# EAGLE design mbc_88_24_01_06_ac (EAGLE 7.6.0)

## Sheet 1 of 2
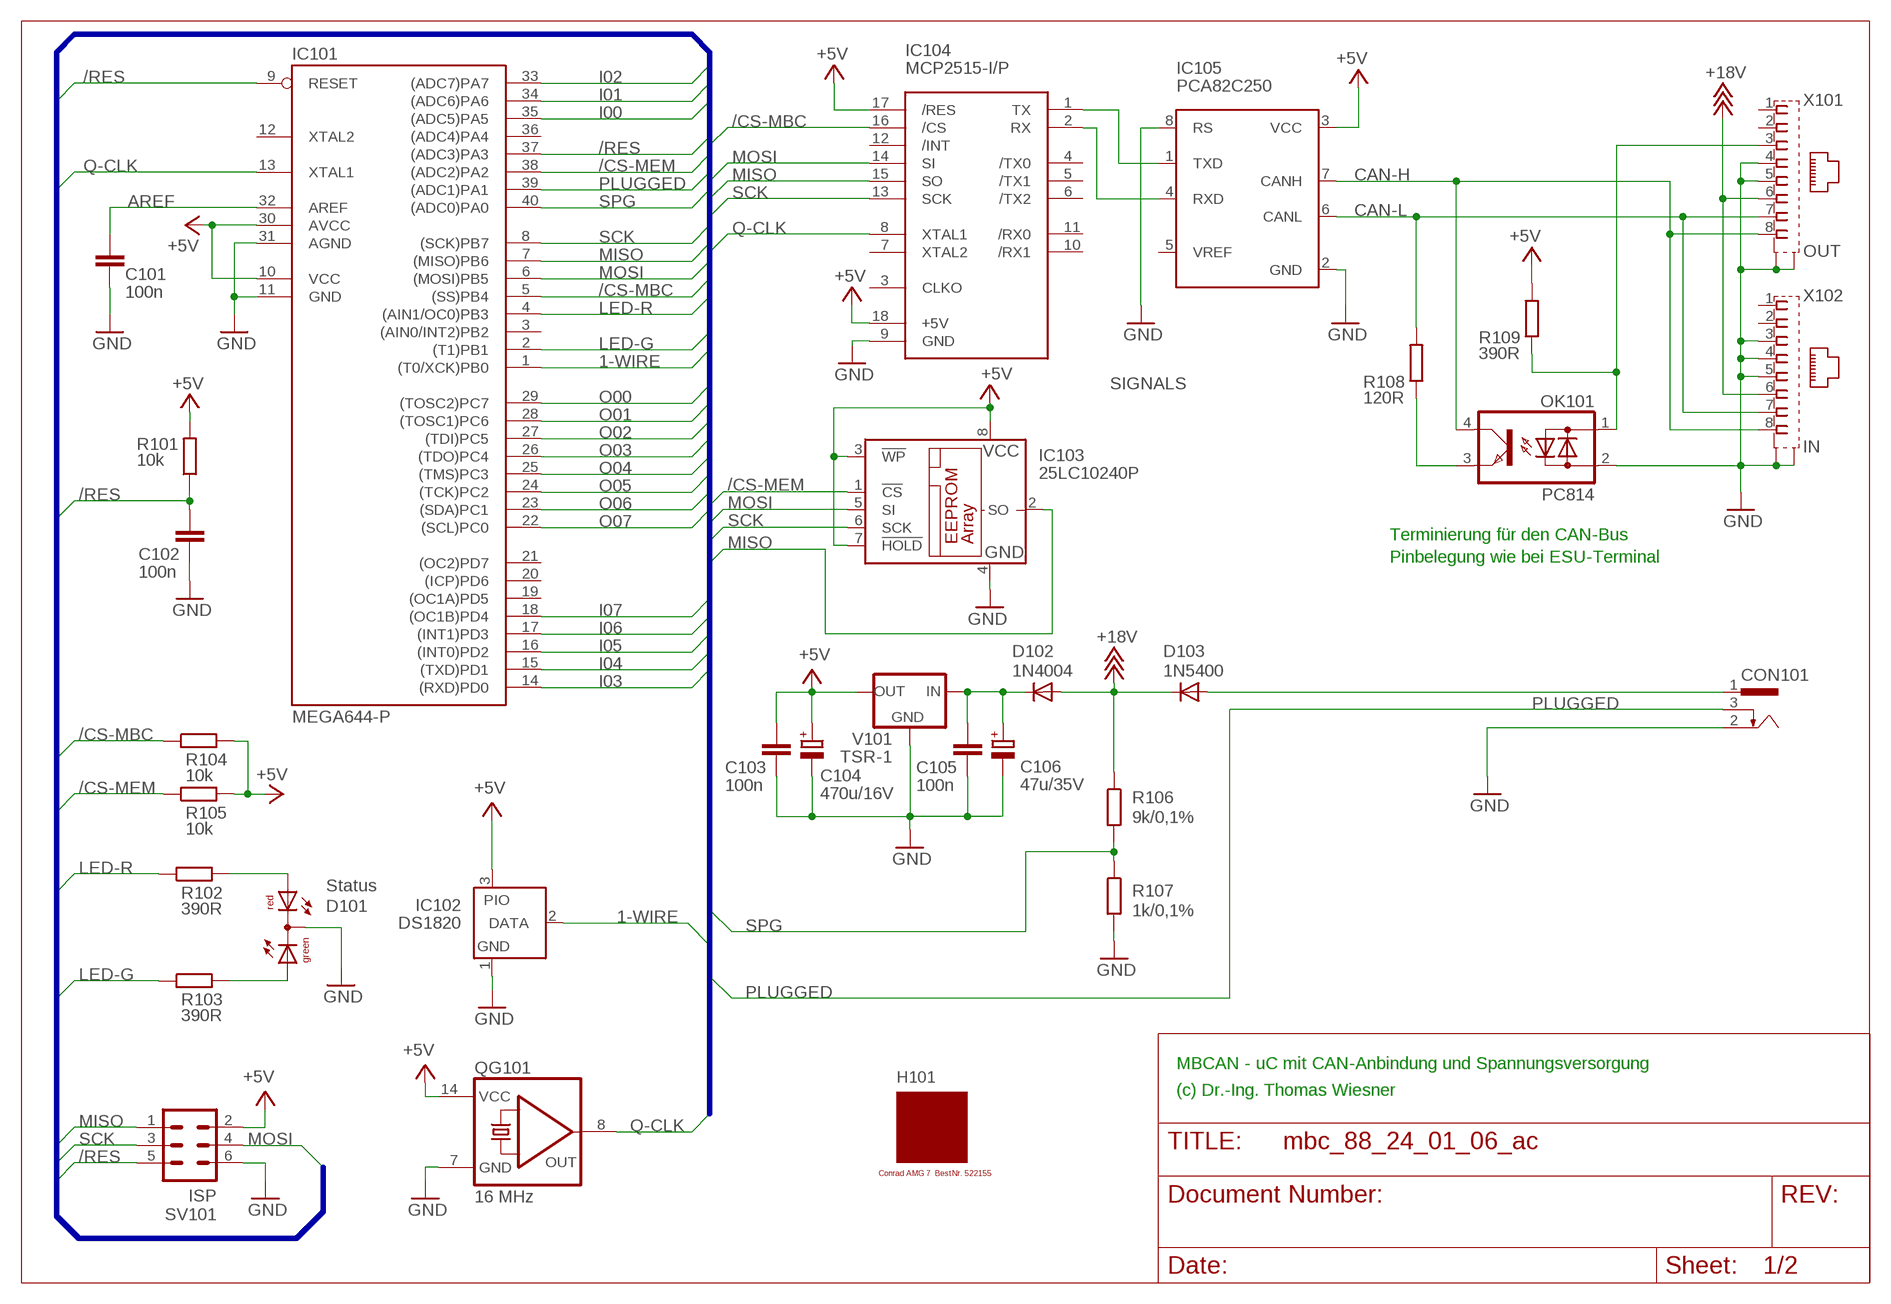
[diagram p0: schematic, sheet 1]

### Parts
C101  100n  C-EU025-025X050  [C025-025X050]
C102  100n  C-EU025-025X050  [C025-025X050]
C103  100n  C-EU025-025X050  [C025-025X050]
C104  470u/16V  CPOL-EUE3.5-8  [E3,5-8]
C105  100n  C-EU025-025X050  [C025-025X050]
C106  47u/35V  CPOL-EUE2.5-7  [E2,5-7]
CON101  POWER-JACK  [POWER-JACK]
D101  Status  DUOLED5MM  [DUOLED5MM]
D102  1N4004  [DO41-10]
D103  1N5400  [DO201-15]
H101  MODULGEHÄUSE-AMG-7  [MODULGEHÄUSE-1]
IC101  MEGA644-P  MEGA323-P  [DIL40]
IC102  DS1820  DS2405  [TO92-]
IC103  25LC10240P  25LC040P  [DIL8]
IC104  MCP2515-I/P  MCP2510-I/P  [DIL18]
IC105  PCA82C250  [DIL08]
OK101  PC814  [DIL04]
QG101  16 MHz  QG5860  [DIL14S]
R101  10k  R-EU_0207/10  [0207/10]
R102  390R  R-EU_0207/10  [0207/10]
R103  390R  R-EU_0207/10  [0207/10]
R104  10k  R-EU_0207/10  [0207/10]
R105  10k  R-EU_0207/10  [0207/10]
R106  9k/0,1%  R-EU_0207/10  [0207/10]
R107  1k/0,1%  R-EU_0207/10  [0207/10]
R108  120R  R-EU_0207/10  [0207/10]
R109  390R  R-EU_0207/10  [0207/10]
SV101  ISP  ML6  [ML6]
V101  TSR-1  [TRACO-TSR-1]
X101  OUT  0446200002  [0446200002]
X102  IN  0446200002  [0446200002]

### Nets
1-WIRE: IC101.1((T0/XCK)PB0) IC102.2(DATA)
+5V: C103.1 C104.+ IC101.10(VCC) IC101.30(AVCC) IC102.3(PIO) IC103.3(!WP) IC103.7(!HOLD) IC103.8(VCC) IC104.17(/RES) IC104.18(+5V) IC105.3(VCC) QG101.14(VCC) R101.2 R104.2 R105.2 R109.2 SV101.2 V101.OUT ; also sheet 2
+18V: D102.A D103.C R106.1 X101.6 X102.6
/CS-MBC: IC101.5((SS)PB4) IC104.16(/CS) R104.1
/CS-MEM: IC101.38((ADC2)PA2) IC103.1(!CS) R105.1
/RES: C102.1 IC101.9(RESET) IC101.37((ADC3)PA3) R101.1 SV101.5
AREF: C101.1 IC101.32(AREF)
CAN-H: IC105.7(CANH) OK101.4(C) X101.8 X102.8
CAN-L: IC105.6(CANL) R108.2 X101.7 X102.7
GND: C101.2 C102.2 C103.2 C104.- C105.2 C106.- CON101.2 D101.K(C) IC101.11(GND) IC101.31(AGND) IC102.1(GND) IC103.4(GND) IC104.9(GND) IC105.2(GND) IC105.8(RS) OK101.2(AC2) QG101.7(GND) R107.2 SV101.6 V101.GND X101.4 X101.5 X101.S@1(S1) X101.S@2(S2) X102.3 X102.4 X102.5 X102.S@1(S1) X102.S@2(S2) ; also sheet 2
I00: IC101.35((ADC5)PA5) ; also sheet 2
I01: IC101.34((ADC6)PA6) ; also sheet 2
I02: IC101.33((ADC7)PA7) ; also sheet 2
I03: IC101.14((RXD)PD0) ; also sheet 2
I04: IC101.15((TXD)PD1) ; also sheet 2
I05: IC101.16((INT0)PD2) ; also sheet 2
I06: IC101.17((INT1)PD3) ; also sheet 2
I07: IC101.18((OC1B)PD4) ; also sheet 2
LED-G: IC101.2((T1)PB1) R103.1
LED-R: IC101.4((AIN1/OC0)PB3) R102.1
MISO: IC101.7((MISO)PB6) IC103.2(SO) IC104.15(SO) SV101.1
MOSI: IC101.6((MOSI)PB5) IC103.5(SI) IC104.14(SI) SV101.4
N$1: IC104.1(TX) IC105.1(TXD)
N$2: IC104.2(RX) IC105.4(RXD)
N$3: OK101.1(AC1) R109.1 X101.3
N$5: OK101.3(E) R108.1
N$6: C105.1 C106.+ D102.C V101.IN
N$9: D101.AR R102.2
N$13: D101.AG R103.2
O00: IC101.29((TOSC2)PC7) ; also sheet 2
O01: IC101.28((TOSC1)PC6) ; also sheet 2
O02: IC101.27((TDI)PC5) ; also sheet 2
O03: IC101.26((TDO)PC4) ; also sheet 2
O04: IC101.25((TMS)PC3) ; also sheet 2
O05: IC101.24((TCK)PC2) ; also sheet 2
O06: IC101.23((SDA)PC1) ; also sheet 2
O07: IC101.22((SCL)PC0) ; also sheet 2
PLUGGED: CON101.3 IC101.39((ADC1)PA1)
Q-CLK: IC101.13(XTAL1) IC104.8(XTAL1) QG101.8(OUT)
SCK: IC101.8((SCK)PB7) IC103.6(SCK) IC104.13(SCK) SV101.3
SPG: IC101.40((ADC0)PA0) R106.2 R107.1
V-NETZTEIL1: CON101.1 D103.A
Unconnected: IC101.3((AIN0/INT2)PB2) IC101.12(XTAL2) IC101.19((OC1A)PD5) IC101.20((ICP)PD6) IC101.21((OC2)PD7) IC101.36((ADC4)PA4) IC104.3(CLKO) IC104.4(/TX0) IC104.5(/TX1) IC104.6(/TX2) IC104.7(XTAL2) IC104.10(/RX1) IC104.11(/RX0) IC104.12(/INT) IC105.5(VREF) X101.1 X101.2 X102.1 X102.2

### Buses
SIGNALS

### Notes on the sheet
- Terminierung für den CAN-Bus
- Pinbelegung wie bei ESU-Terminal
- MBCAN - uC mit CAN-Anbindung und Spannungsversorgung
- (c) Dr.-Ing. Thomas Wiesner

## Sheet 2 of 2
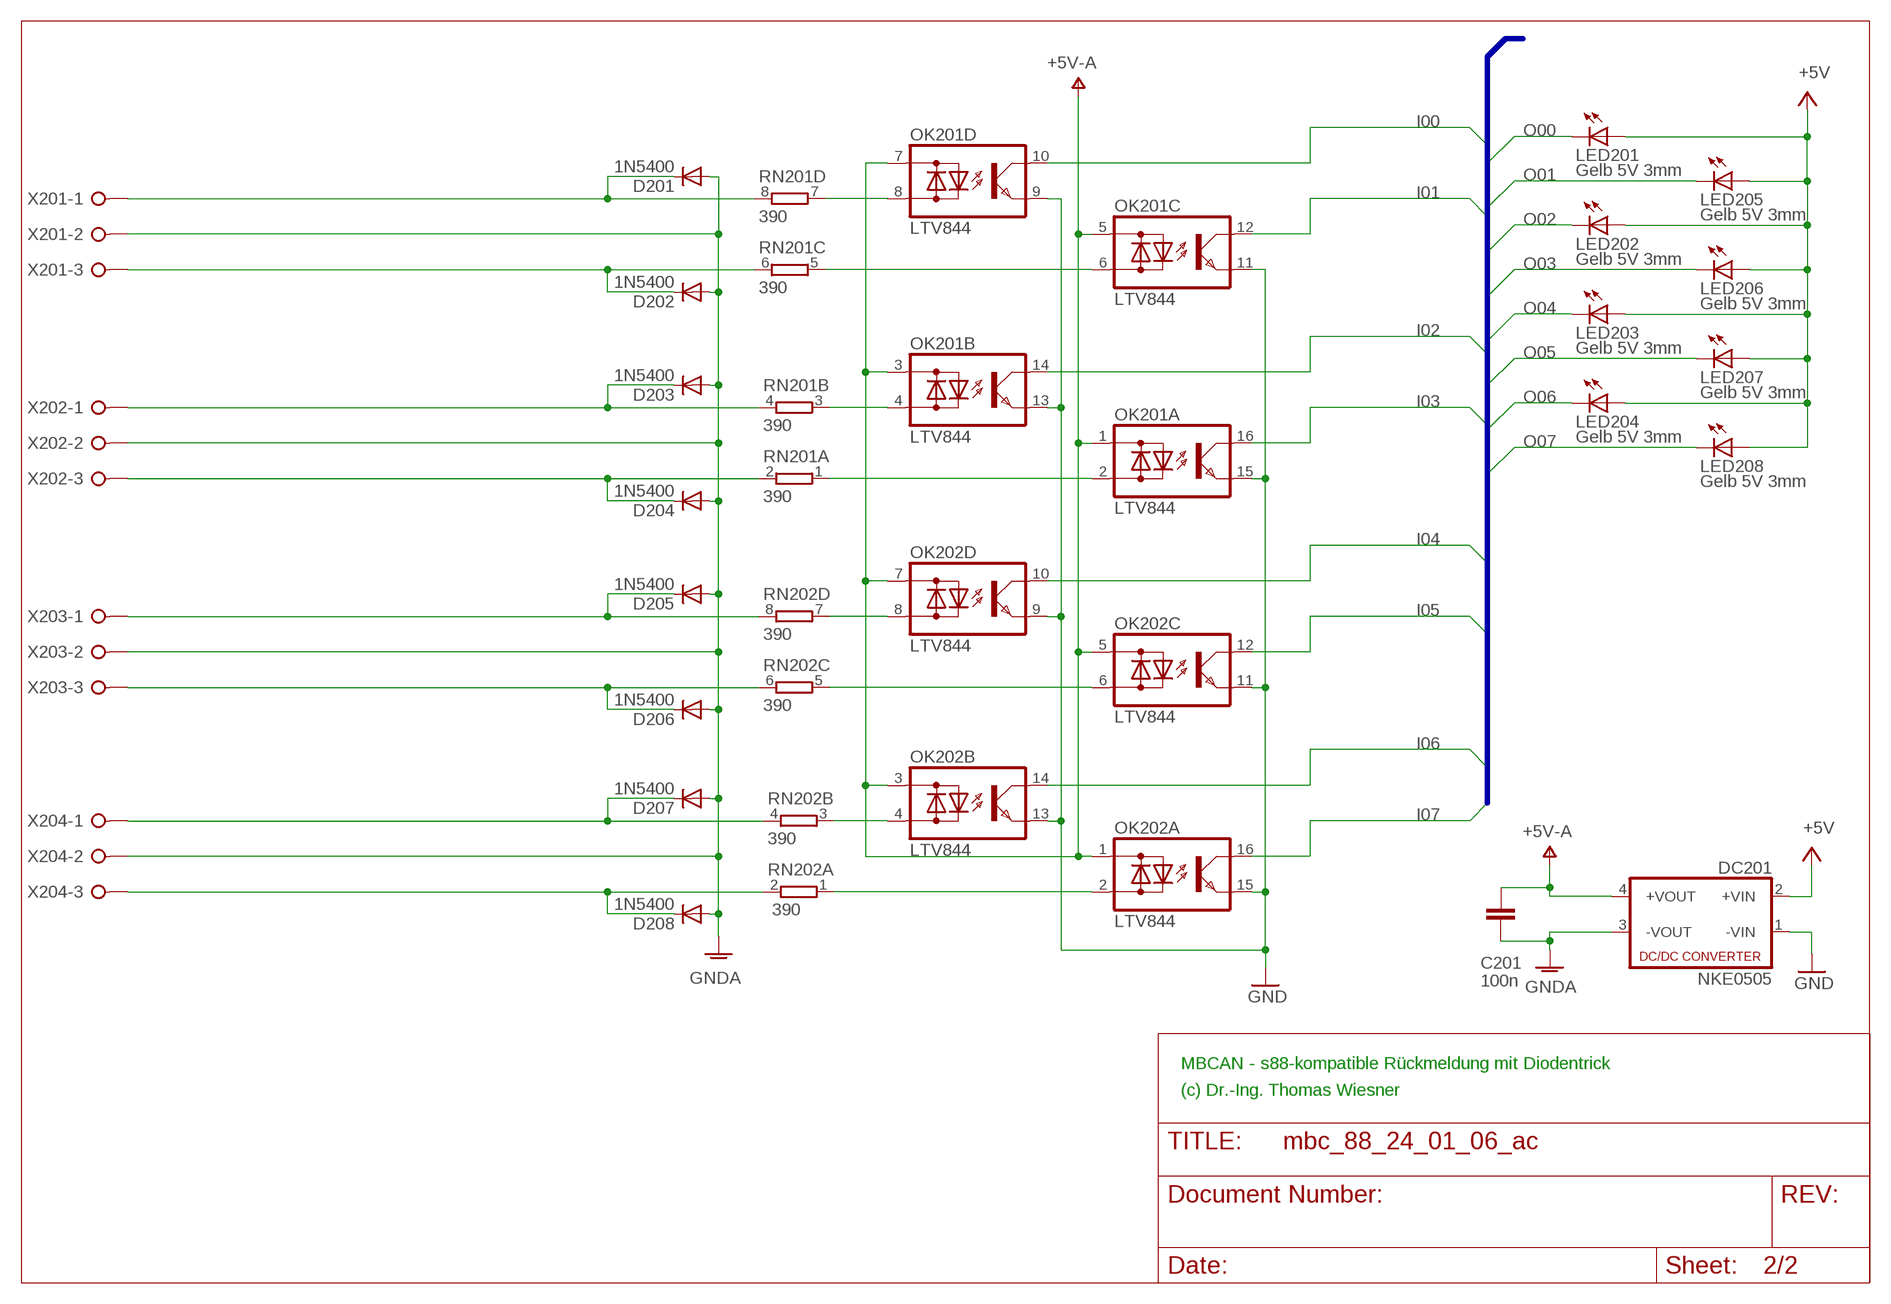
[diagram p1: schematic, sheet 2]

### Parts
C201  100n  C-EU025-025X050  [C025-025X050]
D201  1N5400  [DO201-15]
D202  1N5400  [DO201-15]
D203  1N5400  [DO201-15]
D204  1N5400  [DO201-15]
D205  1N5400  [DO201-15]
D206  1N5400  [DO201-15]
D207  1N5400  [DO201-15]
D208  1N5400  [DO201-15]
DC201  NKE0505  NME  [NME]
LED201  Gelb 5V 3mm  LED3MM  [LED3MM]
LED202  Gelb 5V 3mm  LED3MM  [LED3MM]
LED203  Gelb 5V 3mm  LED3MM  [LED3MM]
LED204  Gelb 5V 3mm  LED3MM  [LED3MM]
LED205  Gelb 5V 3mm  LED3MM  [LED3MM]
LED206  Gelb 5V 3mm  LED3MM  [LED3MM]
LED207  Gelb 5V 3mm  LED3MM  [LED3MM]
LED208  Gelb 5V 3mm  LED3MM  [LED3MM]
OK201  LTV844  TIL196  [DIL16]
OK202  LTV844  TIL196  [DIL16]
RN201  390  E4R  [SIL8]
RN202  390  E4R  [SIL8]
X201  W237-03P  [W237-133]
X202  W237-03P  [W237-133]
X203  W237-03P  [W237-133]
X204  W237-03P  [W237-133]

### Nets
+5V: DC201.2(+VIN) LED201.A LED202.A LED203.A LED204.A LED205.A LED206.A LED207.A LED208.A ; also sheet 1
GND: DC201.1(-VIN) OK201.9(D:E) OK201.11(C:E) OK201.13(B:E) OK201.15(A:E) OK202.9(D:E) OK202.11(C:E) OK202.13(B:E) OK202.15(A:E) ; also sheet 1
GNDA: C201.2 D201.A D202.A D203.A D204.A D205.A D206.A D207.A D208.A DC201.3(-VOUT) X201.2 X202.2 X203.2 X204.2
I00: OK201.10(D:C) ; also sheet 1
I01: OK201.12(C:C) ; also sheet 1
I02: OK201.14(B:C) ; also sheet 1
I03: OK201.16(A:C) ; also sheet 1
I04: OK202.10(D:C) ; also sheet 1
I05: OK202.12(C:C) ; also sheet 1
I06: OK202.14(B:C) ; also sheet 1
I07: OK202.16(A:C) ; also sheet 1
N$24: D207.C RN202.4 X204.1
N$25: D208.C RN202.2 X204.3
N$26: D205.C RN202.8 X203.1
N$27: D206.C RN202.6 X203.3
N$28: D203.C RN201.4 X202.1
N$29: D204.C RN201.2 X202.3
N$30: D201.C RN201.8 X201.1
N$42: OK202.2(A:AC2) RN202.1
N$43: OK202.4(B:AC2) RN202.3
N$44: OK202.6(C:AC2) RN202.5
N$45: OK202.8(D:AC2) RN202.7
N$46: OK201.2(A:AC2) RN201.1
N$47: D202.C RN201.6 X201.3
N$48: OK201.4(B:AC2) RN201.3
N$64: OK201.6(C:AC2) RN201.5
N$65: OK201.8(D:AC2) RN201.7
O00: LED201.K(C) ; also sheet 1
O01: LED205.K(C) ; also sheet 1
O02: LED202.K(C) ; also sheet 1
O03: LED206.K(C) ; also sheet 1
O04: LED203.K(C) ; also sheet 1
O05: LED207.K(C) ; also sheet 1
O06: LED204.K(C) ; also sheet 1
O07: LED208.K(C) ; also sheet 1
V+: C201.1 DC201.4(+VOUT) OK201.1(A:AC1) OK201.3(B:AC1) OK201.5(C:AC1) OK201.7(D:AC1) OK202.1(A:AC1) OK202.3(B:AC1) OK202.5(C:AC1) OK202.7(D:AC1) ; supply symbol labelled +5V-A

### Buses
B$1

### Notes on the sheet
- MBCAN - s88-kompatible Rückmeldung mit Diodentrick
- (c) Dr.-Ing. Thomas Wiesner

## Library data of the parts
C101-C103 C105 C201 = rcl:C-EU: CAPACITOR, European symbol
C104 C106 = rcl:CPOL-EU: POLARIZED CAPACITOR, European symbol
CON101 = mbc:POWER-JACK: Power-Stecker für 2,5 mm Hohlbuchse
D101 = led:DUOLED5MM: DUO LED 2 colors, 5 mm, round
D102 = diode:1N4004: DIODE general purpose rectifier, 1 A
D103 D201-D208 = diode:1N5400: DIODE standard rectifier, 3 A, 50 V (Motorola)
DC201 = dc-dc-converter:NME: DC-DC CONVERTER; MF: C & D TECHNOLOGIES, INC; MPN: NME1205D; OC_FARNELL: 1021466; OC_NEWARK: 98B8198
H101 = mbc:MODULGEHÄUSE-AMG-7: Gehäuse Conrad AMG 7 BestNr. 522155
IC101 = atmel:MEGA323-P: MICROCONTROLLER 32 Kbytes FLASH 2 Kbytes SRAM 1 Kbytes EEPROM USART 8-channel 10 bit ADC Source: avr.lbr; OC_FARNELL: unknown; OC_NEWARK: unknown
IC102 = maxim:DS2405: Addressable Switch DALLAS Semiconductor; MF: DALLAS SEMICONDUCTOR; MPN: DS2405; OC_FARNELL: 1188025; OC_NEWARK: 06F4645
IC103 = microchip:25*: Serial EEPROM 4K/ 8K , SPI bus; MF: MICROCHIP; MPN: 25LC040/P; OC_FARNELL: 9758100; OC_NEWARK: 96K4091
IC104 = mbc:MCP2510: BASIC-CAN 2.0a Controller Stand-alone CAN controller von Microchip
IC105 = micro-philips:PCA82C250: CAN CONTROLLER INTERFACE; OC_FARNELL: 3692358; OC_NEWARK: unknown
LED201-LED208 = led:LED: LED OSRAM: - CHIPLED LG R971, LG N971, LY N971, LG Q971, LY Q971, LO R971, LY R971 LH N974, LH R974 LS Q976, LO Q976, LY Q976 LO Q996 - Hyper CHIPLED LW Q18S LB Q993, LB Q99A, LB R99A - SideLED LS A670, LO A670, LY A670, LG A670, LP A670 LB A673, LV A673, LT A673, LW A673 LH A674 LY A675 LS A676, LA A676, LO A676, LY A676, LW A676 LS A679, LY A679, LG A679 - Hyper Micro SIDELED® LS Y876, LA Y876, LO Y876, LY Y876 LT Y87S - SmartLED LW L88C, LW L88S LB L89C, LB L89S, LG L890 LS L89K, LO L89K, LY L89K LS L896, LA L896, LO L896, LY L896 - TOPLED LS T670, LO T670, LY T670, LG T670, LP T670 LSG T670, LSP T670, LSY T670, LOP T670, LYG T670 LG T671, LOG T671, LSG T671 LB T673, LV T673, LT T673, LW T673 LH T674 LS T676, LA T676, LO T676, LY T676, LB T676, LH T676, LSB T676, LW T676 LB T67C, LV T67C, LT T67C, LS T67K, LO T67K, LY T67K, LW E67C LS E67B, LA E67B, LO E67B, LY E67B, LB E67C, LV E67C, LT E67C LW T67C LS T679, LY T679, LG T679 LS T770, LO T770, LY T770, LG T770, LP T770 LB T773, LV T773, LT T773, LW T773 LH T774 LS E675, LA E675, LY E675, LS T675 LS T776, LA T776, LO T776, LY T776, LB T776 LHGB T686 LT T68C, LB T68C - Hyper Mini TOPLED® LB M676 - Mini TOPLED Santana® LG M470 LS M47K, LO M47K, LY M47K Source: http://www.osram.convergy.de LUXEON: - LUMILED® LXK2-PW12-R00, LXK2-PW12-S00, LXK2-PW14-U00, LXK2-PW14-V00 LXK2-PM12-R00, LXK2-PM12-S00, LXK2-PM14-U00 LXK2-PE12-Q00, LXK2-PE12-R00, LXK2-PE12-S00, LXK2-PE14-T00, LXK2-PE14-U00 LXK2-PB12-K00, LXK2-PB12-L00, LXK2-PB12-M00, LXK2-PB14-N00, LXK2-PB14-P00, LXK2-PB14-Q00 LXK2-PR12-L00, LXK2-PR12-M00, LXK2-PR14-Q00, LXK2-PR14-R00 LXK2-PD12-Q00, LXK2-PD12-R00, LXK2-PD12-S00 LXK2-PH12-R00, LXK2-PH12-S00 LXK2-PL12-P00, LXK2-PL12-Q00, LXK2-PL12-R00 Source: www.luxeon.com KINGBRIGHT: KA-3528ASYC Source: www.kingbright.com
OK101 = optocoupler:PC814: SHARP OPTO COUPLER; OC_FARNELL: 9707662; OC_NEWARK: unknown
OK201 OK202 = optocoupler:TIL196: TEXAS INSTRUMENTS OPTO COUPLER; MPN: TIL 196; OC_FARNELL: 1683367; OC_NEWARK: 05R6476
QG101 = crystal:QG5860: CRYSTAL RESONATOR; OC_FARNELL: unknown; OC_NEWARK: unknown
R101-R109 = resistor:R-EU_: RESISTOR, European symbol
RN201 RN202 = resistor-sil:E4R: SIL RESISTOR; OC_FARNELL: unknown; OC_NEWARK: unknown
SV101 = con-ml:ML6: HARTING; OC_FARNELL: unknown; OC_NEWARK: unknown
V101 = mbc:TSR-1: Spannungsregler Hersteller: TRACO Typ: TSR-1 5V: TSR 1-2450 Spg: 5V Strom: 1A Reichelt TSR 1-2450
X101 X102 = mbc:0446200002: RJ-45 INVERTED MODULAR JACK ASSEMBLY WITH RJ-11 KEEPOUT FEATURE Source: Data sheet <http://www.farnell.com/datasheets/73207.pdf> MOLEX 0446200002 BUCHSE, RJ45, GESCHIRMT Source: Farnell <http://de.farnell.com/molex/0446200002/buchse-rj45-geschirmt/dp/9251910?ost=9251910>; MF: MOLEX; MPN: 0446200002; OC_FARNELL: 9251910
X201-X204 = con-wago-508:W237-03P: WAGO SREW CLAMP; OC_FARNELL: unknown; OC_NEWARK: unknown

## Board
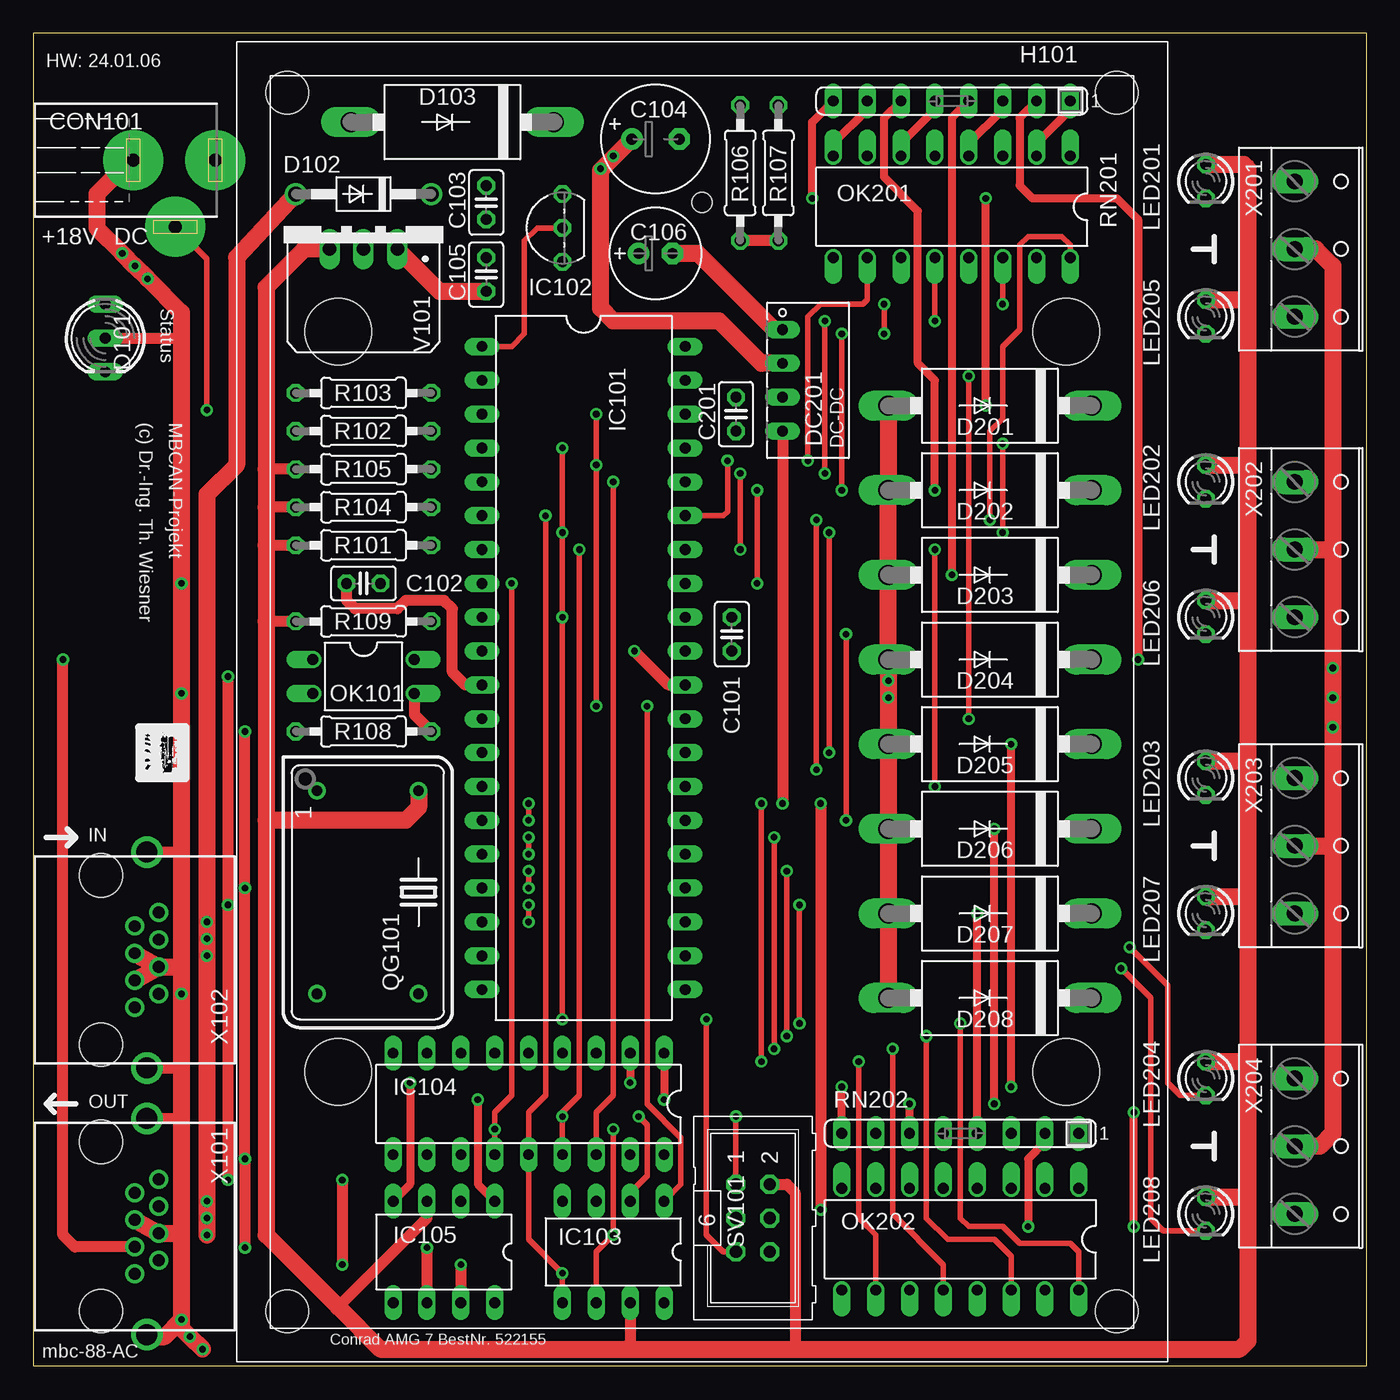
[diagram p2: board, top side]
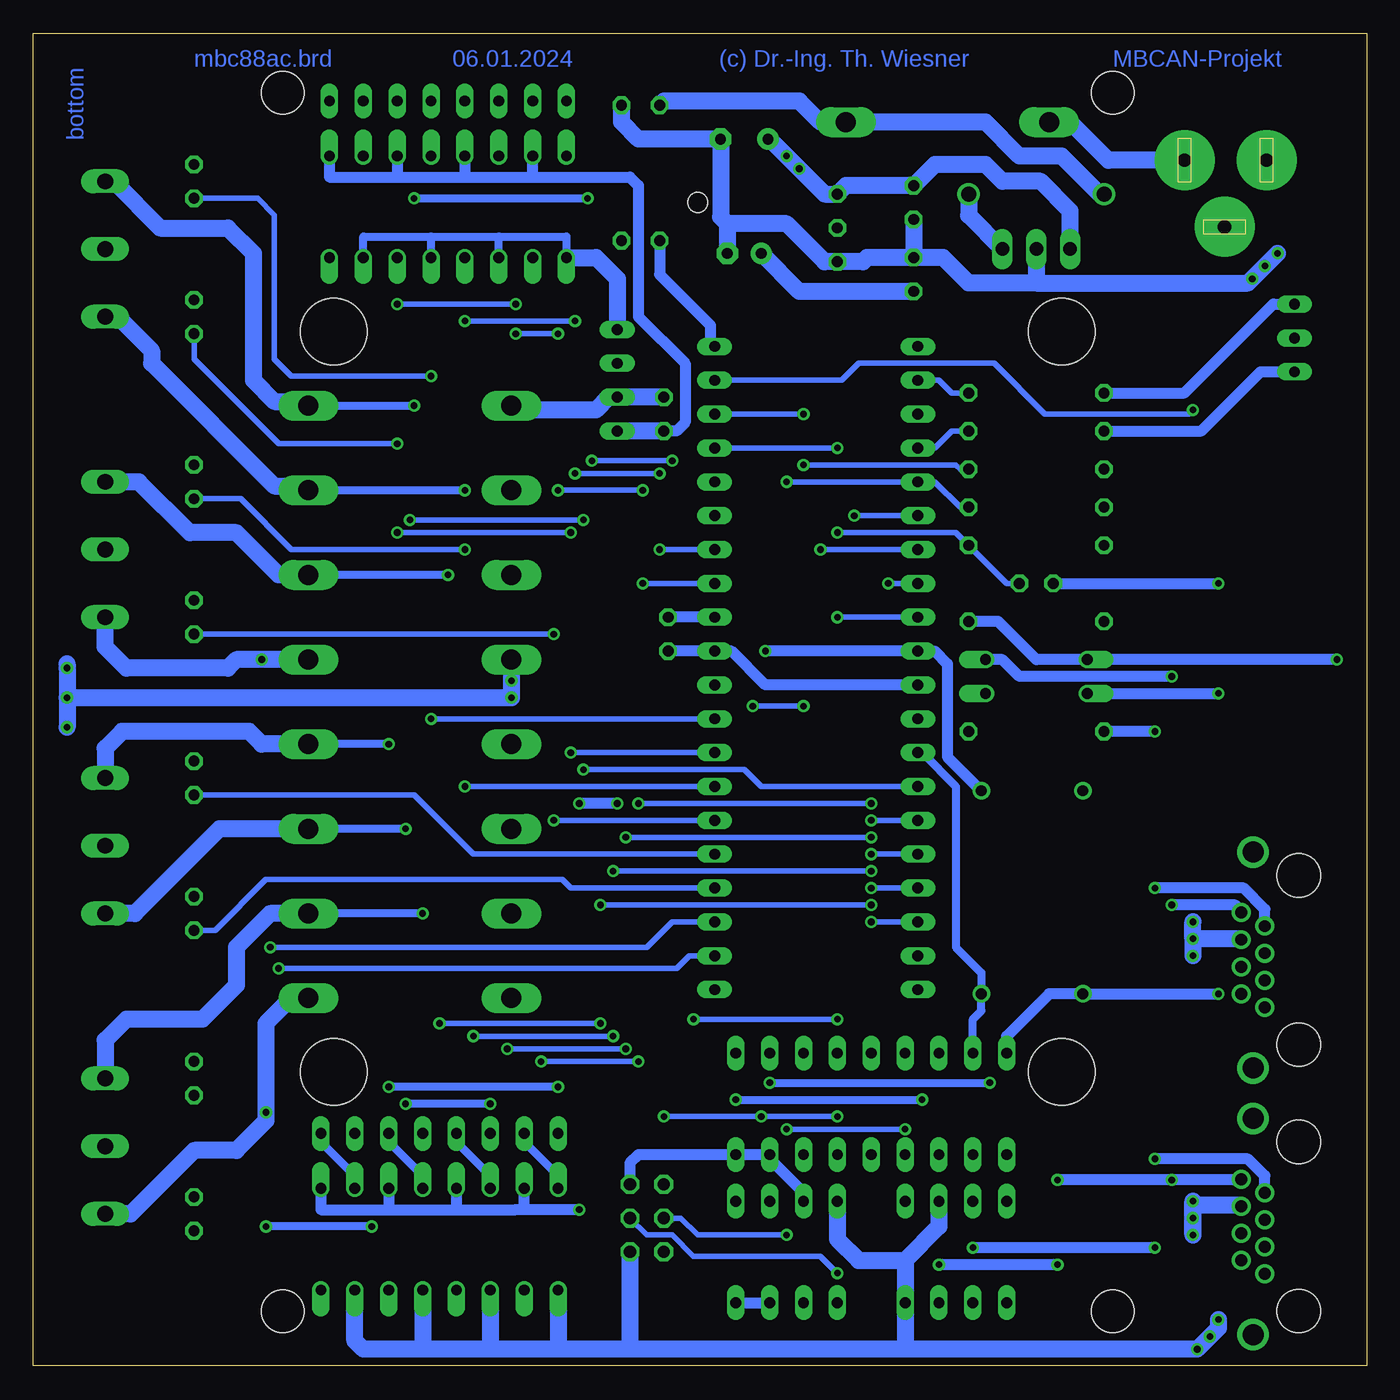
[diagram p3: board, bottom side, seen from below]

Size 100 x 99.99 mm. Coordinates in mm from the lower left corner, seen from the top.
Outline: 0,99.99 0,0 100,0 100,99.99 0,99.99
Copper layers (1*16): Top 0.035mm / dielectric 1.5mm / Bottom 0.035mm
Design rules "default *": minimum track width 10mil, minimum drill 0.5mm, track to track 8mil, track to pad 8mil, pad to pad 8mil, via to via 8mil, smd to smd 8mil, copper to edge 40mil, drill to drill 8mil, minimum pad ring 10mil, minimum via ring 8mil, stop-mask expansion 4mil, vias tented up to drill 0mil, thermal gap 10mil

### Footprints (pad centres in the part's own frame; a part is rotated, then mirrored left to right if it is on the bottom)
C025-025X050 = drill 0.813 octagon: 1 -1.27,0; 2 1.27,0
E3,5-8 = drill 0.813 pad 1.6: + -1.778,0 | drill 0.813 pad 1.6 octagon: - 1.778,0
E2,5-7 = drill 0.813 pad 1.6: + -1.27,0 | drill 0.813 pad 1.6 octagon: - 1.27,0
POWER-JACK = drill 1 pad 4.5: 1 0,6.03; 2 0,-0.12; 3 5,3.03
DUOLED5MM = drill 0.813 long: AG -2.54,0; AR 2.54,0; K 0,0
DO41-10 = drill 1.118: A 5.08,0; C -5.08,0
DO201-15 = drill 1.499 long: A 7.62,0; C -7.62,0
NME = drill 0.813 long: 1 0,3.81; 2 0,1.27; 3 0,-1.27; 4 0,-3.81
MODULGEHÄUSE-1 = hole 3.2: -45.72,-31.115; -45.72,31.115; 45.72,31.115; 45.72,-31.115 | hole 5: -27.781,-27.305; 27.781,-27.305; -27.781,27.305; 27.781,27.305 | hole 1.5: -37.465,0
DIL40 = drill 0.813 long: 1 -24.13,-7.62; 2 -21.59,-7.62; 3 -19.05,-7.62; 4 -16.51,-7.62; 5 -13.97,-7.62; 6 -11.43,-7.62; 7 -8.89,-7.62; 8 -6.35,-7.62; 9 -3.81,-7.62; 10 -1.27,-7.62; 11 1.27,-7.62; 12 3.81,-7.62; 13 6.35,-7.62; 14 8.89,-7.62; 15 11.43,-7.62; 16 13.97,-7.62; 17 16.51,-7.62; 18 19.05,-7.62; 19 21.59,-7.62; 20 24.13,-7.62; 21 24.13,7.62; 22 21.59,7.62; 23 19.05,7.62; 24 16.51,7.62; 25 13.97,7.62; 26 11.43,7.62; 27 8.89,7.62; 28 6.35,7.62; 29 3.81,7.62; 30 1.27,7.62; 31 -1.27,7.62; 32 -3.81,7.62; 33 -6.35,7.62; 34 -8.89,7.62; 35 -11.43,7.62; 36 -13.97,7.62; 37 -16.51,7.62; 38 -19.05,7.62; 39 -21.59,7.62; 40 -24.13,7.62
TO92- = drill 0.813 octagon: 1 -2.54,0; 2 0,0; 3 2.54,0
DIL8 = drill 0.813 long: 1 -3.81,-3.81; 2 -1.27,-3.81; 3 1.27,-3.81; 4 3.81,-3.81; 5 3.81,3.81; 6 1.27,3.81; 7 -1.27,3.81; 8 -3.81,3.81
DIL18 = drill 0.813 long: 1 -10.16,-3.81; 2 -7.62,-3.81; 3 -5.08,-3.81; 4 -2.54,-3.81 | drill 0.8 long: 5 0,-3.81; 6 2.54,-3.81; 7 5.08,-3.81; 8 7.62,-3.81; 9 10.16,-3.81; 10 10.16,3.81; 11 7.62,3.81; 12 5.08,3.81; 13 2.54,3.81; 14 0,3.81; 15 -2.54,3.81; 16 -5.08,3.81; 17 -7.62,3.81; 18 -10.16,3.81
DIL08 = drill 0.813 long: 1 -3.81,-3.81; 2 -1.27,-3.81; 3 1.27,-3.81; 4 3.81,-3.81; 5 3.81,3.81; 6 1.27,3.81; 7 -1.27,3.81; 8 -3.81,3.81
LED3MM = drill 0.813 octagon: A -1.27,0; K 1.27,0
DIL04 = drill 0.813 offset: 1 -1.27,-3.81; 2 1.27,-3.81; 3 1.27,3.81; 4 -1.27,3.81
DIL16 = drill 0.813 offset: 1 -8.89,-3.81; 2 -6.35,-3.81; 3 -3.81,-3.81; 4 -1.27,-3.81; 5 1.27,-3.81; 6 3.81,-3.81; 7 6.35,-3.81; 8 8.89,-3.81; 9 8.89,3.81; 10 6.35,3.81; 11 3.81,3.81; 12 1.27,3.81; 13 -1.27,3.81; 14 -3.81,3.81; 15 -6.35,3.81; 16 -8.89,3.81
DIL14S = drill 0.813: 1 -7.62,-3.81; 7 7.62,-3.81; 8 7.62,3.81; 14 -7.62,3.81
0207/10 = drill 0.813 octagon: 1 -5.08,0; 2 5.08,0
SIL8 = drill 0.813 long: 1 -8.89,0; 2 -6.35,0; 3 -3.81,0; 4 -1.27,0; 5 1.27,0; 6 3.81,0; 7 6.35,0; 8 8.89,0
ML6 = drill 0.914 octagon: 1 -2.54,-1.27; 2 -2.54,1.27; 3 0,-1.27; 4 0,1.27; 5 2.54,-1.27; 6 2.54,1.27
TRACO-TSR-1 = drill 1.016 long: GND 0,2.54; IN -2.54,2.54; OUT 2.54,2.54
0446200002 = drill 0.889 pad 1.422: 1 3.556,2.54; 2 2.54,4.318; 3 1.524,2.54; 4 0.508,4.318; 5 -0.508,2.54; 6 -1.524,4.318; 7 -2.54,2.54; 8 -3.556,4.318 | drill 1.575 pad 2.286: S@1 -8.103,3.429; S@2 8.103,3.429 | hole 3.251: 6.35,0; -6.35,0
W237-133 = drill 1.194 long: 1 -5.08,-0.635; 2 0,-0.635; 3 5.08,-0.635

### Placement (x,y rotation side)
C101  52.39,54.91 270 top
C102  24.77,58.72 180 top
C103  33.97,87.29 270 top
C104  46.67,92.06 0 top
C105  33.97,81.9 90 top
C106  46.67,83.48 0 top
C201  52.7,71.42 90 top
CON101  7.62,90.47 270 top
D101  5.4,77.13 270 top
D102  24.77,87.93 180 top
D103  31.43,93.33 180 top
D201  71.75,72.05 180 top
D202  71.75,65.7 180 top
D203  71.75,59.35 180 top
D204  71.75,53 180 top
D205  71.75,46.65 180 top
D206  71.75,40.3 180 top
D207  71.75,33.95 180 top
D208  71.75,27.6 180 top
DC201  56.2,73.96 0 top
H101  50.16,49.83 270 top
IC101  41.27,52.37 270 top
IC102  39.69,85.39 90 top
IC103  43.5,8.55 180 top
IC104  37.15,19.66 180 top
IC105  30.8,8.55 180 top
LED201  87.95,88.88 270 top
LED202  87.95,66.34 270 top
LED203  87.95,44.11 270 top
LED204  87.95,21.57 270 top
LED205  87.95,78.72 270 top
LED206  87.95,56.18 270 top
LED207  87.95,33.95 270 top
LED208  87.95,11.41 270 top
OK101  24.77,51.73 270 top
OK201  68.9,86.98 180 top
OK202  69.53,9.51 180 top
QG101  25.08,35.54 270 top
R101  24.77,61.57 180 top
R102  24.77,70.15 180 top
R103  24.77,73.01 180 top
R104  24.77,64.43 180 top
R105  24.77,67.29 180 top
R106  53.02,89.52 270 top
R107  55.88,89.52 90 top
R108  24.77,47.6 180 top
R109  24.77,55.86 180 top
RN201  68.9,94.91 180 top
RN202  69.53,17.44 180 top
SV101  53.98,11.09 270 top
V101  24.77,86.34 180 top
X101  5.08,10.46 270 top
X102  5.08,30.46 270 top
X201  95.25,83.8 270 top
X202  95.25,61.26 270 top
X203  95.25,39.03 270 top
X204  95.25,16.49 270 top

### Tracks (layer width: path | path; a pad name or v marks a point on that pad's centre or on a via)
1-WIRE
  Top 0.406: IC102.2 37.78,85.39 36.83,84.44 36.83,77.45 35.88,76.5 IC101.1
+5V  (via drill 0.5)
  Top 0.813: R104.2 17.46,64.43 | R101.2 17.46,61.57 | R105.2 17.46,67.29 | R109.2 17.46,55.86 | v45.09,53.64 47.62,51.1 IC101.30 | IC103.7 44.77,1.57 44.45,1.25 | SV101.2 56.52,13.63 57.15,13 57.15,1.25 | IC105.3 29.53,11.09 22.86,4.43
  Top 1.27: V101.OUT 20.32,83.8 17.46,80.94 17.46,67.29 17.46,64.43 17.46,61.57 17.46,55.86 17.46,40.94 | 17.46,40.94 17.46,9.82 22.86,4.43 26.04,1.25 44.45,1.25 57.15,1.25 90.49,1.25 91.12,1.89 91.12,12.68 | 91.12,12.68 91.12,23.16 | 91.12,23.16 91.12,35.54 | 91.12,35.54 91.12,45.38 | 91.12,45.38 91.12,57.45 | 91.12,57.45 91.12,67.61 | 91.12,67.61 91.12,80.31 | 91.12,80.31 91.12,89.83 90.81,90.15 LED201.A | LED205.A 90.81,79.99 91.12,80.31 | LED202.A 91.12,67.61 | LED206.A 91.12,57.45 | LED203.A 91.12,45.38 | LED207.A 90.81,35.22 91.12,35.54 | LED204.A 90.81,22.84 91.12,23.16 | LED208.A 91.12,12.68 | QG101.14 28.89,41.89 27.94,40.94 17.46,40.94 | DC201.2 54.61,75.23 51.44,78.4 43.5,78.4 42.55,79.36 42.55,89.7 C104.+
  Bottom 0.813: v45.09,53.64 IC101.10 32.38,53.64 31.43,52.68 31.43,45.7 QG101.14 | IC103.3 42.23,13 44.77,15.54 IC104.17 IC104.18 54.61,15.86 55.24,15.22 SV101.2 | IC103.8 IC103.7
  Bottom 1.27: C104.+ 44.77,92.06 v43.5,90.79 v42.55,89.83 40.64,87.93 IC102.3 39.05,88.56 C103.1 32.38,90.15 28.57,90.15 27.3,88.88 24.45,88.88 22.23,86.66 V101.OUT
+18V  (via drill 0.5)
  Top 1.27: D102.A 15.24,83.17 15.24,67.61 13.02,65.39 v13.02,33.32 v13.02,32.05 v13.02,30.78 v13.02,12.36 v13.02,11.09 v13.02,9.82
  Bottom 1.27: X101.6 9.4,12.04 13.02,12.04 v13.02,9.82 v13.02,11.09 v13.02,12.36 | X102.6 9.4,32.05 v13.02,32.05 | v13.02,32.05 v13.02,33.32 | v13.02,32.05 v13.02,30.78 | D102.A 20,87.93 22.86,90.79 26.04,90.79 28.57,93.33 D103.C 40.96,93.33 42.55,94.91 52.7,94.91 R106.1
/CS-MBC  (via drill 0.5)
  Top 0.406: IC104.16 42.23,19.03 43.5,20.3 v43.5,66.34
  Bottom 0.406: v43.5,66.34 IC101.5 32.38,66.34 30.48,64.43 R104.1
/CS-MEM  (via drill 0.5)
  Top 0.406: v42.23,71.42 v42.23,67.61 v42.23,49.51 | IC103.1 48.58,13.63 48.58,17.12 46.04,19.66 v46.04,49.51
  Bottom 0.406: R105.1 30.48,67.29 30.8,67.61 v42.23,67.61 | v42.23,71.42 IC101.38 | v46.04,49.51 v42.23,49.51
/RES  (via drill 0.5)
  Top 0.406: v39.69,26.02 v39.69,56.18 v39.69,62.53 v39.69,68.88 | v50.48,26.02 50.48,9.82 51.75,8.55 SV101.5
  Bottom 0.406: C102.1 26.99,58.72 R101.1 30.8,62.53 v39.69,62.53 | v39.69,26.02 v50.48,26.02 | v39.69,68.88 IC101.37 | IC101.9 v39.69,56.18
AREF
  Bottom 0.813: IC101.32 C101.1
CAN-H  (via drill 0.5)
  Top 0.813: v14.61,13.95 v14.61,34.59 v14.61,51.73 | v23.18,13.95 v23.18,7.6 | v32.07,7.6 IC105.7
  Bottom 0.813: X101.8 9.4,13.95 v14.61,13.95 v23.18,13.95 | v14.61,51.73 26.04,51.73 27.3,53 OK101.4 | X102.8 9.4,34.14 9.84,34.59 v14.61,34.59 | v23.18,7.6 v32.07,7.6
CAN-L  (via drill 0.5)
  Top 0.813: v15.88,47.6 v15.88,35.86 v15.88,15.54 v15.88,8.87 | v29.53,8.87 IC105.6
  Bottom 0.813: X101.7 7.62,14.27 8.89,15.54 v15.88,15.54 | v15.88,47.6 R108.2 | X102.7 7.62,34.27 9.21,35.86 v15.88,35.86 | v15.88,8.87 v29.53,8.87
GND  (via drill 0.5)
  Top 0.813: X101.S@1 10.64,18.56 11.11,19.03 | X102.S@1 10.64,38.56 11.11,39.03 | D101.K 10.79,77.13 11.11,76.81 | IC101.11 32.38,51.1 31.43,52.05 31.43,56.81 30.8,57.45 27.94,57.45 27.3,56.81 24.13,56.81 23.5,57.45 C102.2 | X102.S@2 10.95,22.36 11.11,22.52
  Top 1.27: CON101.2 7.3,90.47 4.76,87.93 4.76,85.39 v6.67,83.48 v7.62,82.53 v8.57,81.58 11.11,79.04 11.11,76.81 v11.11,58.72 v11.11,50.46 11.11,39.03 11.11,30.14 | 11.11,30.14 v11.11,27.92 11.11,22.52 11.11,19.03 11.11,9.82 | 11.11,9.82 v11.11,3.47 | v11.11,3.47 11.11,2.84 v11.75,2.2 v12.7,1.25 | v11.11,3.47 9.84,2.2 8.66,2.2 X101.S@2 | X102.4 10.92,29.95 arc90 11.11,30.14 | 11.11,9.82 arc90 10.99,9.95 X101.4 X101.5 | X102.5 X102.4 | X102.3 X102.4 | C106.- 49.85,83.48 55.56,77.77 DC201.1
  Bottom 0.61: OK201.15 75.25,84.75 70.17,84.75 | 70.17,84.75 65.09,84.75 | 65.09,84.75 60.01,84.75 OK201.9 | OK201.11 65.09,84.75 | OK201.13 70.17,84.75
  Bottom 0.813: v11.11,27.92 QG101.7 23.81,27.92 26.99,24.75 IC104.9 | OK101.2 v11.11,50.46 | IC101.11 45.09,51.1 47.62,53.64 IC101.31 C101.2 | C102.2 v11.11,58.72
  Bottom 1.27: 34.61,1.25 v12.7,1.25 11.11,2.84 v11.11,3.47 | 34.61,1.25 55.24,1.25 | 55.24,1.25 60.96,1.25 | 60.96,1.25 65.72,1.25 | 65.72,1.25 70.8,1.25 | 70.8,1.25 75.25,1.25 75.88,1.89 OK202.15 | 24.77,81.26 8.89,81.26 v8.57,81.58 v7.62,82.53 v6.67,83.48 | V101.GND 24.77,81.26 | 24.77,81.26 29.84,81.26 31.75,83.17 C105.2 | C105.2 37.47,83.17 37.78,82.85 IC102.1 40.64,82.85 43.5,85.7 47.94,85.7 | C103.2 C105.2 | 47.94,85.7 C106.- | 47.94,85.7 48.45,86.21 C104.- 54.61,92.06 55.88,93.33 R107.2 | OK201.9 57.78,83.17 56.2,81.58 DC201.1 | OK202.13 70.8,1.25 | OK202.11 65.72,1.25 | OK202.9 60.64,1.57 60.96,1.25 | SV101.6 55.24,1.25 | 34.61,1.25 IC105.8 34.61,7.92 | IC105.2 32.07,10.46 34.61,7.92 | IC103.4 39.69,9.51 38.1,7.92 34.61,7.92
GNDA  (via drill 0.5)
  Top 1.27: D201.A D202.A D203.A D204.A v64.14,51.41 v64.14,50.14 D205.A D206.A D207.A D208.A | X201.2 96.2,83.8 97.47,82.53 97.47,61.26 | 97.47,61.26 v97.47,52.37 v97.47,50.14 v97.47,47.92 97.47,39.35 | 97.47,39.35 97.47,17.44 96.52,16.49 X204.2 | X203.2 97.16,39.03 97.47,39.35 | X202.2 97.47,61.26
  Bottom 1.27: 97.47,52.68 v97.47,52.37 v97.47,50.14 | v97.47,50.14 v97.47,47.92 | v97.47,50.14 v64.14,50.14 v64.14,51.41 D204.A | C201.2 DC201.3 56.83,72.69 57.78,71.73 63.82,71.73 D201.A
I00  (via drill 0.5)
  Top 0.406: OK201.10 62.55,79.99 62.23,79.67 59.05,79.67 58.1,78.72 v58.1,67.92 | v52.07,67.92 52.07,64.12 51.75,63.8 IC101.35
  Bottom 0.406: v58.1,67.92 v52.07,67.92
I01  (via drill 0.5)
  Top 0.406: OK201.12 v67.63,78.4 | v59.37,78.4 v59.37,66.97 | v53.02,66.97 v53.02,61.26
  Bottom 0.406: v67.63,78.4 v59.37,78.4 | v59.37,66.97 v53.02,66.97 | v53.02,61.26 IC101.34
I02  (via drill 0.5)
  Top 0.406: OK201.14 v72.71,79.67 | v63.82,79.67 v63.82,77.45 | v60.64,77.45 v60.64,65.7 | v54.29,65.7 v54.29,58.72
  Bottom 0.406: v72.71,79.67 v63.82,79.67 | v63.82,77.45 v60.64,77.45 | v60.64,65.7 v54.29,65.7 | v54.29,58.72 IC101.33
I03  (via drill 0.5)
  Top 0.406: v58.74,44.75 v58.74,63.48 | v71.75,63.48 71.75,70.15 72.71,71.1 72.71,76.5 73.98,77.77 73.98,84.12 74.61,84.75 77.15,84.75 77.79,84.12 OK201.16
  Bottom 0.406: IC101.14 45.4,43.48 46.67,44.75 v58.74,44.75 | v58.74,63.48 v71.75,63.48
I04  (via drill 0.5)
  Top 0.406: OK202.10 63.18,9.82 61.91,11.09 v61.91,22.84 | v54.61,22.84 v54.61,42.21 | v37.15,42.21 v37.15,40.94
  Bottom 0.406: v61.91,22.84 v54.61,22.84 | v54.61,42.21 v37.15,42.21 | v37.15,40.94 IC101.15
I05  (via drill 0.5)
  Top 0.406: OK202.12 68.26,7.6 64.45,11.41 v64.45,23.79 | v55.56,23.79 v55.56,39.67 | v37.15,39.67 v37.15,38.4
  Bottom 0.406: v64.45,23.79 v55.56,23.79 | v55.56,39.67 v37.15,39.67 | v37.15,38.4 IC101.16
I06  (via drill 0.5)
  Top 0.406: OK202.14 73.34,8.24 72.07,9.51 68.58,9.51 66.99,11.09 v66.99,24.75 | v56.52,24.75 v56.52,37.13 | v37.15,37.13 v37.15,35.86
  Bottom 0.406: v66.99,24.75 v56.52,24.75 | v56.52,37.13 v37.15,37.13 | v37.15,35.86 IC101.17
I07  (via drill 0.5)
  Top 0.406: OK202.16 78.42,8.55 77.79,9.19 73.98,9.19 72.71,10.46 70.17,10.46 69.53,11.09 v69.53,25.7 | v57.47,25.7 v57.47,34.59 | v37.15,34.59 v37.15,33.32
  Bottom 0.406: v69.53,25.7 v57.47,25.7 | v57.47,34.59 v37.15,34.59 | v37.15,33.32 IC101.18
LED-G
  Bottom 0.406: R103.1 31.11,73.01 32.07,73.96 IC101.2
LED-R
  Bottom 0.406: R102.1 31.11,70.15 32.38,68.88 IC101.4
MISO  (via drill 0.5)
  Top 0.406: IC104.15 v39.69,18.71 39.69,19.03 40.96,20.3 v40.96,61.26 | SV101.1 v52.7,18.71 | IC103.2 44.77,13 46.04,14.27 46.04,18.08 v45.4,18.71
  Bottom 0.406: v40.96,61.26 IC101.7 | v52.7,18.71 v45.4,18.71 v39.69,18.71
MOSI  (via drill 0.5)
  Top 0.406: v38.42,63.8 38.42,20.3 37.15,19.03 IC104.14 37.15,9.51 v39.69,6.97 IC103.5
  Bottom 0.406: v38.42,63.8 IC101.6 | SV101.4 53.98,9.82 52.07,9.82 50.48,8.24 40.96,8.24 v39.69,6.97
N$1  (via drill 0.5)
  Top 0.61: IC104.1 v47.31,19.98 | v33.34,19.98 33.34,13.63 IC105.1
  Bottom 0.61: v47.31,19.98 v33.34,19.98
N$2  (via drill 0.5)
  Top 0.61: IC104.2 v44.77,21.25 | v28.26,21.25 28.26,13.63 IC105.4
  Bottom 0.61: v44.77,21.25 v28.26,21.25
N$3  (via drill 0.5)
  Top 0.813: X101.3 3.11,8.93 2.22,9.82 v2.22,53
  Bottom 0.813: v2.22,53 OK101.1 24.77,53 27.62,55.86 R109.1
N$5
  Top 0.813: OK101.3 28.57,48.88 R108.1
N$6
  Top 1.27: C105.1 30.48,80.62 V101.IN
  Bottom 1.27: D102.C 29.84,86.34 V101.IN | C105.1 42.55,80.62 C106.+
N$9
  Bottom 0.813: R102.2 12.38,70.15 7.94,74.59 D101.AR
N$13
  Bottom 0.813: R103.2 13.65,73.01 6.99,79.67 D101.AG
N$24  (via drill 0.5)
  Top 0.61: RN202.4 v70.8,33.95
  Bottom 0.61: v70.8,33.95 D207.C
  Bottom 1.27: D207.C 82.23,33.95 84.77,31.41 84.77,28.55 87.31,26.02 93.03,26.02 94.61,24.43 X204.1
N$25  (via drill 0.5)
  Top 0.61: RN202.2 75.88,16.81 74.61,15.54 v74.61,10.46 | v82.55,10.46 v82.55,19.03
  Bottom 0.61: v74.61,10.46 v82.55,10.46
  Bottom 1.27: D208.C 80.64,27.6 82.55,25.7 v82.55,19.03 82.55,18.39 84.77,16.17 87.95,16.17 92.71,11.41 X204.3
N$26  (via drill 0.5)
  Top 0.61: RN202.8 v60.64,20.93 | v73.34,20.93 v73.34,46.65
  Bottom 0.61: v60.64,20.93 v73.34,20.93 | v73.34,46.65 D205.C
  Bottom 1.27: D205.C 82.87,46.65 83.82,47.6 93.34,47.6 94.61,46.33 X203.1
N$27  (via drill 0.5)
  Top 0.61: RN202.6 v65.72,19.66 | v72.07,19.66 v72.07,40.3
  Bottom 0.61: v65.72,19.66 v72.07,19.66 | v72.07,40.3 D206.C
  Bottom 1.27: D206.C 86.04,40.3 92.39,33.95 X203.3
N$28  (via drill 0.5)
  Top 0.61: RN201.4 68.9,93.64 v68.9,59.35
  Bottom 0.61: v68.9,59.35 D203.C
  Bottom 1.27: D203.C 81.6,59.35 84.77,62.53 88.27,62.53 92.08,66.34 X202.1
N$29  (via drill 0.5)
  Top 0.61: RN201.2 73.98,93.64 73.98,88.56 74.93,87.61 81.28,87.61 82.87,86.02 v82.87,53
  Bottom 0.61: v82.87,53 D204.C
  Bottom 1.27: D204.C 84.77,53 85.41,52.37 93.03,52.37 94.61,53.95 X202.3
N$30  (via drill 0.5)
  Top 0.61: v71.44,72.05 v71.44,87.61 | v58.42,87.61 58.42,93.33 RN201.8
  Bottom 0.61: D201.C v71.44,72.05 | v71.44,87.61 v58.42,87.61
  Bottom 1.27: X201.1 93.98,88.88 90.49,85.39 85.41,85.39 83.5,83.48 83.5,73.96 81.92,72.37 79.69,72.37 D201.C
N$42
  Bottom 0.61: OK202.2 75.88,14.27 78.42,16.81 RN202.1
N$43
  Bottom 0.61: OK202.4 70.8,14.27 73.34,16.81 RN202.3
N$44
  Bottom 0.61: OK202.6 65.72,14.27 68.26,16.81 RN202.5
N$45
  Bottom 0.61: OK202.8 60.64,14.27 63.18,16.81 RN202.7
N$46
  Top 0.61: OK201.2 75.25,91.74 77.79,94.28 RN201.1
N$47  (via drill 0.5)
  Top 0.61: v67.63,65.7 67.63,73.96 66.36,75.23 66.36,86.66 63.82,89.2 63.82,93.64 RN201.6
  Bottom 0.61: D202.C v67.63,65.7
  Bottom 1.27: X201.3 93.66,78.72 91.12,76.18 91.12,75.23 81.92,66.02 79.69,66.02 D202.C
N$48
  Top 0.61: OK201.4 70.17,91.74 72.71,94.28 RN201.3
N$64
  Top 0.61: OK201.6 65.09,91.74 67.63,94.28 RN201.5
N$65
  Top 0.61: OK201.8 60.01,91.74 62.55,94.28 RN201.7
O00  (via drill 0.5)
  Top 0.406: v70.17,74.28 v70.17,48.56
  Bottom 0.406: LED201.K 83.19,87.61 81.92,86.34 81.92,75.55 80.64,74.28 v70.17,74.28 | v70.17,48.56 IC101.29
O01  (via drill 0.5)
  Top 0.406: v72.71,69.2 v72.71,62.53 | v59.69,62.53 v59.69,46.02
  Bottom 0.406: LED205.K 87.95,75.55 81.6,69.2 v72.71,69.2 | v72.71,62.53 v59.69,62.53 | v59.69,46.02 IC101.28
O02  (via drill 0.5)
  Top 0.406: v67.63,61.26 v67.63,43.48
  Bottom 0.406: LED202.K 84.45,65.07 80.64,61.26 v67.63,61.26 | v67.63,43.48 IC101.27
O03  (via drill 0.5)
  Top 0.406: v60.96,54.91 v60.96,40.94
  Bottom 0.406: LED206.K v60.96,54.91 | v60.96,40.94 IC101.26
O04
  Bottom 0.406: LED203.K 71.44,42.84 66.99,38.4 IC101.25
O05
  Bottom 0.406: LED207.K 86.36,32.68 82.55,36.49 60.33,36.49 59.69,35.86 IC101.24
O06  (via drill 0.5)
  Top 0.406: LED204.K 86.04,20.3 85.09,21.25 85.09,28.55 v82.23,31.41
  Bottom 0.406: v82.23,31.41 53.98,31.41 52.07,33.32 IC101.23
O07  (via drill 0.5)
  Top 0.406: LED208.K 84.77,10.14 83.82,11.09 83.82,27.6 v81.6,29.82
  Bottom 0.406: v81.6,29.82 51.75,29.82 50.8,30.78 IC101.22
PLUGGED  (via drill 0.5)
  Top 0.406: v13.02,71.73 13.02,83.1 CON101.3
  Bottom 0.406: IC101.39 39.37,73.96 38.1,75.23 27.94,75.23 24.13,71.42 13.34,71.42 v13.02,71.73
Q-CLK
  Bottom 0.61: IC101.13 33.34,46.02 30.8,43.48 30.8,31.41 28.89,29.51 QG101.8 28.89,26.65 29.53,26.02 IC104.8
SCK  (via drill 0.5)
  Top 0.406: IC104.13 v34.61,17.76 34.61,19.03 35.88,20.3 v35.88,58.72 | IC103.6 42.23,8.55 v43.5,9.82 v43.5,17.76
  Bottom 0.406: v35.88,58.72 IC101.8 | v43.5,17.76 v34.61,17.76 | SV101.3 51.44,11.09 50.16,9.82 v43.5,9.82
SPG
  Top 0.813: R107.1 R106.2
  Bottom 0.813: R106.2 53.02,81.9 49.21,78.09 49.21,76.81 IC101.40
V+  (via drill 0.5)
  Top 0.813: DC201.4 v56.2,42.21 | v59.05,42.21 v59.05,11.73
  Bottom 0.61: 63.82,11.73 63.18,11.73
  Bottom 0.813: OK202.1 78.42,11.73 73.34,11.73 | 73.34,11.73 68.26,11.73 | 68.26,11.73 63.82,11.73 v59.05,11.73 | 63.18,11.73 OK202.7 | OK202.3 73.34,11.73 | OK202.5 68.26,11.73 | OK201.1 77.79,89.2 72.71,89.2 | 72.71,89.2 67.63,89.2 | 67.63,89.2 62.55,89.2 | 62.55,89.2 OK201.7 | OK201.5 67.63,89.2 | OK201.3 72.71,89.2 | 62.55,89.2 55.24,89.2 54.61,88.56 54.61,78.72 51.12,75.23 51.12,70.78 51.75,70.15 C201.1 | v56.2,42.21 v59.05,42.21
  Bottom 1.27: C201.1 DC201.4
V-NETZTEIL1
  Bottom 1.27: CON101.1 19.37,90.47 22.23,93.33 D103.A

### Text on the board
Bottom: MBCAN-Projekt | (c) Dr.-Ing. Th. Wiesner | 06.01.2024 | mbc88ac.brd | bottom
tNames: HW: 24.01.06 | +18V | DC | Status | (c) Dr.-Ing. Th. Wiesner | MBCAN-Projekt | IN | OUT | mbc-88-AC